# Altium project POD-Design-v1.0.PrjPcb (part 5 of 7)

## Sheet Ground-Fault-Detect-Sheet-1.SchDoc
size 420 x 297 mm; SheetNumber: 9; SheetTotal: 11
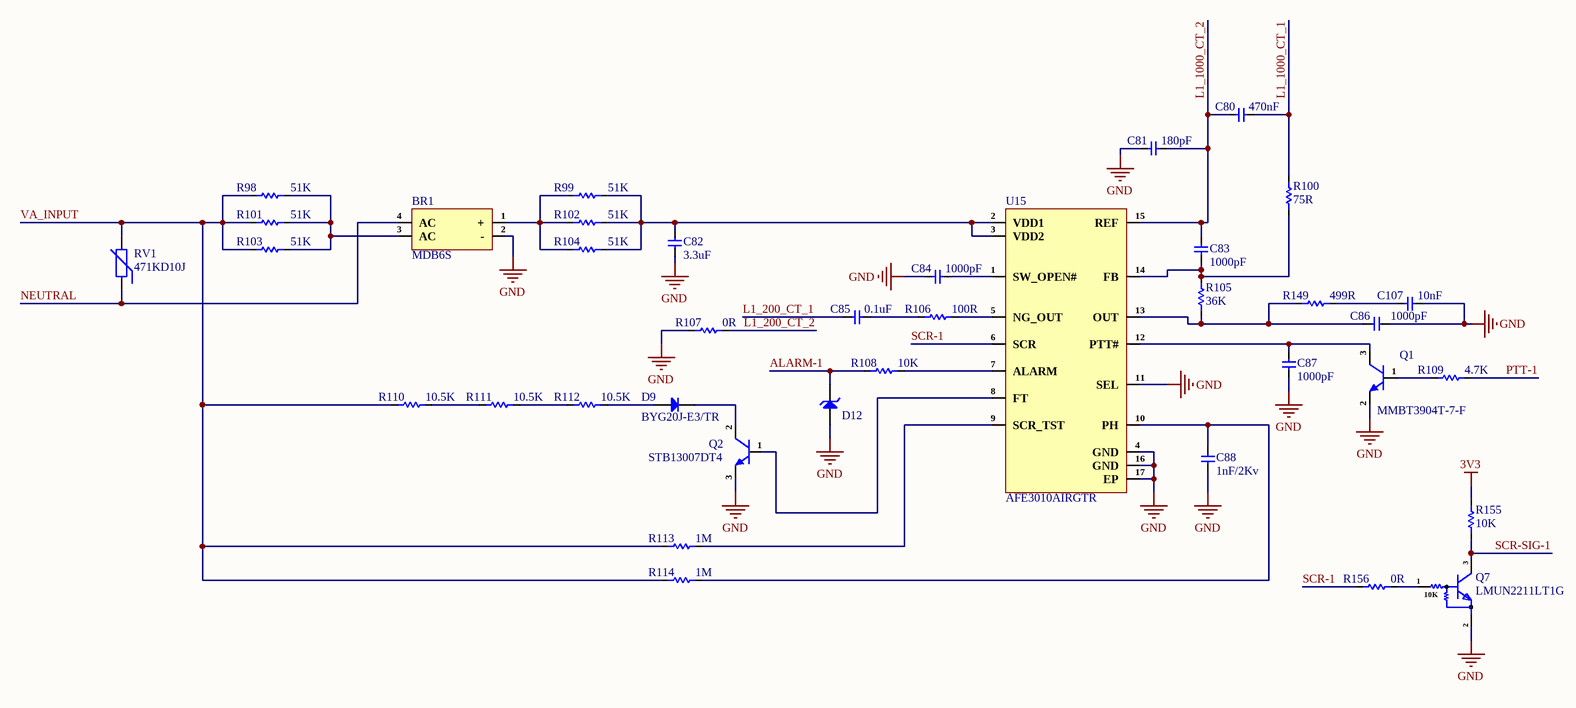
[diagram p8: Ground-Fault-Detect-Sheet-1.SchDoc]

### Parts
BR1  MDB6S  [TSSOP-4(5.0x4.4)]
C80  470nF  [Cap-0603]
C81  180pF  [Cap-0603]
C82  3.3uF  [Cap 2220]
C83  1000pF  [Cap-0603]
C84  1000pF  [Cap-0603]
C85  0.1uF  [Cap-0603]
C86  1000pF  [Cap-0603]
C87  1000pF  [Cap-0603]
C88  1nF/2Kv  [Cap 1808]
C107  10nF  [Cap-0603]
D9  BYG20J-E3/TR  [SMA(DO-214AC)]
D12  MM3Z3V3B  [SOD323F]  (value not drawn)
Q1  MMBT3904T-7-F  [SOT-523]
Q2  STB13007DT4  [D2PAK]
Q7  LMUN2211LT1G  [SOT-23]
R98  51K  [Res-2030]
R99  51K  [Res-2030]
R100  75R  [Res-0603]
R101  51K  [Res-2030]
R102  51K  [Res-2030]
R103  51K  [Res-2030]
R104  51K  [Res-2030]
R105  36K  [Res-0603]
R106  100R  [Res-0603]
R107  0R  [Res-0603]
R108  10K  [Res-0603]
R109  4.7K  [Res-0603]
R110  10.5K  [RES-2010]
R111  10.5K  [RES-2010]
R112  10.5K  [RES-2010]
R113  1M  [RES-2010]
R114  1M  [RES-2010]
R149  499R  [Res-0603]
R155  10K  [Res-0402]
R156  0R  [Res-0603]
RV1  471KD10J  [471KD10J]
U15  AFE3010AIRGTR  [VQFN-16(3x3)]

### Nets
3V3: R155.1
GND: BR1.2(-) C81.1 C82.1 C84.1 C86.1 C87.1 C88.1 C107.2 D12.1(A) Q1.2(E) Q2.3(E) Q7.2(E) R107.1 U15.4(GND) U15.11(SEL) U15.16(GND) U15.17(EP)
ALARM-1: D12.2(K) R108.1
L1_200_CT_1: C85.2
L1_200_CT_2: R107.2
L1_1000_CT_1: C80.2 R100.2
L1_1000_CT_2: C80.1 C81.2 C83.1 U15.15(REF)
NEUTRAL: BR1.4(AC) RV1.1
PTT-1: R109.2
SCR-1: R156.1 U15.6(SCR)
SCR-SIG-1: Q7.3(C) R155.2
VA_INPUT: R98.1 R101.1 R103.1 R110.1 R113.1 R114.1 RV1.2
NetBR1_1: BR1.1(+) R99.1 R102.1 R104.1
NetBR1_3: BR1.3(AC) R98.2 R101.2 R103.2
NetC82_2: C82.2 R99.2 R102.2 R104.2 U15.2(VDD1) U15.3(VDD2)
NetC83_2: C83.2 R100.1 R105.2 U15.14(FB)
NetC84_2: C84.2 U15.1(SW_OPEN#)
NetC85_1: C85.1 R106.1
NetC86_2: C86.2 R105.1 R149.1 U15.13(OUT)
NetC87_2: C87.2 Q1.3(C) U15.12(PTT#)
NetC88_2: C88.2 R114.2 U15.10(PH)
NetC107_1: C107.1 R149.2
NetD9_1: D9.1(K) Q2.2(C)
NetD9_2: D9.2(A) R112.2
NetQ1_1: Q1.1(B) R109.1
NetQ2_1: Q2.1(B) U15.8(FT)
NetQ7_1: Q7.1(B) R156.2
NetR106_2: R106.2 U15.5(NG_OUT)
NetR108_2: R108.2 U15.7(ALARM)
NetR110_2: R110.2 R111.1
NetR111_2: R111.2 R112.1
NetR113_2: R113.2 U15.9(SCR_TST)

### Notes on the sheet
- ZyntelliTech
- File:
- Title:
- Date:
- Page
- Num:
- Total:
- Drawn By: Huzaifa Ali
- (in symbol LMUN2211LT1G) 10K

### Library data of the parts
BR1 = MDB6S: BRIDGE RECT 1P 600V 1A 4MICRODIP; Manufacturer: ON Semiconductor / Fairchild; Item Type: Diodes; Supplier: Future Electronics; LCSC Part Number: C895500; Manufacturer Part Number: MDB6S; RoHS: Yes; Stock: 170000; Pricing: 5000=0.128, 10000=0.126, 15000=0.125 (USD); Lead Free: 5697LeadFree; ComponentLink1URL: https://datasheet.ciiva.com/4433/mdb6s-195692-4433151.pdf?src-supplier=Mouser; ComponentLink1Description: https://datasheet.ciiva.com/4433/mdb6s-195692-4433151.pdf?src-supplier=Mouser; ComponentLink2URL: https://datasheet.ciiva.com/11195/mdb8s-11195777.pdf?src-supplier=Avnet; ComponentLink2Description: https://datasheet.ciiva.com/11195/mdb8s-11195777.pdf?src-supplier=Avnet; ComponentLink3URL: https://datasheet.ciiva.com/30480/0900766b81185ceb-30480759.pdf?src-supplier=Rs; ComponentLink3Description: https://datasheet.ciiva.com/30480/0900766b81185ceb-30480759.pdf?src-supplier=Rs; ComponentLink4URL: https://datasheet.ciiva.com/6390/mdb10s-6390582.pdf?src-supplier=Digikey; ComponentLink4Description: https://datasheet.ciiva.com/6390/mdb10s-6390582.pdf?src-supplier=Digikey; ComponentLink5URL: https://datasheet.ciiva.com/6390/mdb10s-6390583.pdf?src-supplier=Digikey; ComponentLink5Description: https://datasheet.ciiva.com/6390/mdb10s-6390583.pdf?src-supplier=Digikey; ComponentLink6URL: https://datasheet.ciiva.com/6390/mdb10s-6390584.pdf?src-supplier=Digikey; ComponentLink6Description: https://datasheet.ciiva.com/6390/mdb10s-6390584.pdf?src-supplier=Digikey
C80 = CC0603KRX5R9BB474: CAP CER 0.47UF 50V X5R 0603; Manufacturer: Yageo; Tolerance: 10%; Item Type: Capacitor; Supplier 1: Digi-Key; Manufacturer Part Number: CC0603KRX5R9BB474; RoHS: Yes; Category: Ceramic Capacitors; Stock 1: 15145; Pricing 1: 1=0.45000, 10=0.31400, 50=0.22000, 100=0.18860, 500=0.14144, 1000=0.11944 (USD); Mount: Surface Mount; Case/Package: 0603; Min Operating Temperature: -55°C; Max Operating Temperature: 85°C; Packaging: Tape and Reel; Capacitance: 470nF; Voltage Rating: 50V; Voltage Rating (DC): 50V; Dielectric: X5R; Length: 0.063inch; Width: 0.031inch; Thickness: 0.035inch; Lead Free: Lead Free; Halogen Free: Halogen Free; RoHS Compliant: Yes; ComponentLink1URL: https://www.mouser.com/ds/2/447/ProductSelectionGuide 2014_Final_2-1131690.pdf?src-supplier=Mouser; ComponentLink1Description: https://www.mouser.com/ds/2/447/ProductSelectionGuide 2014_Final_2-1131690.pdf?src-supplier=Mouser; ComponentLink2URL: http://www.yageo.com/documents/recent/UPY-GPHC_X5R_4V-to-50V_25.pdf?src-supplier=Digi-Key; ComponentLink2Description: http://www.yageo.com/documents/recent/UPY-GPHC_X5R_4V-to-50V_25.pdf?src-supplier=Digi-Key; ComponentLink3URL: http://www.yageo.com/exep/pages/download/literatures/ProductSelectionGuide%202014_Final_2.pdf?src-supplier=Digi-Key; ComponentLink3Description: http://www.yageo.com/exep/pages/download/literatures/ProductSelectionGuide%202014_Final_2.pdf?src-supplier=Digi-Key; Supplier Part Number 1: 311-4047-1-ND; LCSC Part Number: C513651
C81 = CC0603JRNPO9BN181: CAP CER 180PF 50V C0G/NPO 0603; Manufacturer: Yageo; Item Type: Capacitors; Supplier: Arrow Electronics; LCSC Part Number: C107041; Manufacturer Part Number: CC0603JRNPO9BN181; RoHS: Yes; Stock: 3012000; Pricing: 4000=0.006, 8000=0.0057, 12000=0.0056, 20000=0.0055, 40000=0.0055, 200000=0.0053 (USD); ComponentLink1URL: https://datasheet.ciiva.com/26862/getdatasheetpartid-403527-26862762.pdf?src-supplier=Verical; ComponentLink1Description: https://datasheet.ciiva.com/26862/getdatasheetpartid-403527-26862762.pdf?src-supplier=Verical; ComponentLink2URL: https://datasheet.ciiva.com/176/mlccorderingcode-176405.pdf?src-supplier=Digikey; ComponentLink2Description: https://datasheet.ciiva.com/176/mlccorderingcode-176405.pdf?src-supplier=Digikey; ComponentLink3URL: https://datasheet.ciiva.com/176/mlccorderingcode-176406.pdf?src-supplier=Digikey; ComponentLink3Description: https://datasheet.ciiva.com/176/mlccorderingcode-176406.pdf?src-supplier=Digikey; ComponentLink4URL: https://datasheet.ciiva.com/176/mlccorderingcode-176407.pdf?src-supplier=Digikey; ComponentLink4Description: https://datasheet.ciiva.com/176/mlccorderingcode-176407.pdf?src-supplier=Digikey; ComponentLink5URL: https://datasheet.ciiva.com/5427/upy-gp-np0-16v-to-50v-8-5427755.pdf?src-supplier=Mouser; ComponentLink5Description: https://datasheet.ciiva.com/5427/upy-gp-np0-16v-to-50v-8-5427755.pdf?src-supplier=Mouser; ComponentLink6URL: https://datasheet.ciiva.com/8033/1443161-8033736.pdf?src-supplier=Element14; ComponentLink6Description: https://datasheet.ciiva.com/8033/1443161-8033736.pdf?src-supplier=Element14; ComponentLink7URL: https://datasheet.ciiva.com/8033/1443161-8033738.pdf?src-supplier=Element14; ComponentLink7Description: https://datasheet.ciiva.com/8033/1443161-8033738.pdf?src-supplier=Element14; ComponentLink8URL: https://datasheet.ciiva.com/7978/1132289-7978133.pdf?src-supplier=Element14; ComponentLink8Description: https://datasheet.ciiva.com/7978/1132289-7978133.pdf?src-supplier=Element14
C82 = FS55X335K251EHG: 250V 3.3uF X7R ±10% 2220 Multilayer Ceramic Capacitors MLCC - SMD/SMT ROHS; Manufacturer: PSA(Prosperity Dielectrics); Manufacturer Part Number: FS55X335K251EHG; Package: 2220; LCSC Part Number: C22370027; Item Type: Capacitor; ComponentLink1Description: LCSC; ComponentLink1URL: https://www.lcsc.com/product-detail/Multilayer-Ceramic-Capacitors-MLCC-SMD-SMT_PSA-Prosperity-Dielectrics-FS55X335K251EHG_C22370027.html
C83 C84 C86 C87 = 06031C102KAT2A: CAP CER 1000PF 100V X7R 0603; Manufacturer: Kyocera AVX; Item Type: Capacitor; Supplier: Avnet; LCSC Part Number: C2167292; Manufacturer Part Number: 06031C102KAT2A; RoHS: Yes; Stock: 656000; Pricing: 4000=0.0086, 8000=0.0084, 16000=0.0082, 24000=0.008, 32000=0.0079 (USD); Lead Free: 5697LeadFree; ComponentLink1URL: https://datasheet.ciiva.com/5422/cx7r-218113-5422905.pdf?src-supplier=Mouser; ComponentLink1Description: https://datasheet.ciiva.com/5422/cx7r-218113-5422905.pdf?src-supplier=Mouser; ComponentLink2URL: https://datasheet.ciiva.com/11499/cx7r-11499669.pdf?src-supplier=Avnet; ComponentLink2Description: https://datasheet.ciiva.com/11499/cx7r-11499669.pdf?src-supplier=Avnet; ComponentLink3URL: https://datasheet.ciiva.com/2987/cx7r-2987733.pdf?src-supplier=Avnet; ComponentLink3Description: https://datasheet.ciiva.com/2987/cx7r-2987733.pdf?src-supplier=Avnet; ComponentLink4URL: https://datasheet.ciiva.com/150/cx7r-150395.pdf?src-supplier=Digikey; ComponentLink4Description: https://datasheet.ciiva.com/150/cx7r-150395.pdf?src-supplier=Digikey; ComponentLink5URL: https://datasheet.ciiva.com/150/cx7r-150396.pdf?src-supplier=Digikey; ComponentLink5Description: https://datasheet.ciiva.com/150/cx7r-150396.pdf?src-supplier=Digikey; ComponentLink6URL: https://datasheet.ciiva.com/150/cx7r-150397.pdf?src-supplier=Digikey; ComponentLink6Description: https://datasheet.ciiva.com/150/cx7r-150397.pdf?src-supplier=Digikey; ComponentLink7URL: https://datasheet.ciiva.com/1124/1679506-1124198.pdf?src-supplier=Element14; ComponentLink7Description: https://datasheet.ciiva.com/1124/1679506-1124198.pdf?src-supplier=Element14; ComponentLink8URL: https://datasheet.ciiva.com/22693/1679506-22693579.pdf?src-supplier=Element14; ComponentLink8Description: https://datasheet.ciiva.com/22693/1679506-22693579.pdf?src-supplier=Element14; ComponentLink9URL: https://datasheet.ciiva.com/7855/1679506-7855033.pdf?src-supplier=Element14; ComponentLink9Description: https://datasheet.ciiva.com/7855/1679506-7855033.pdf?src-supplier=Element14; ComponentLink10URL: https://datasheet.ciiva.com/7855/84526-7855189.pdf?src-supplier=Element14; ComponentLink10Description: https://datasheet.ciiva.com/7855/84526-7855189.pdf?src-supplier=Element14; ComponentLink11URL: https://datasheet.ciiva.com/16289/cx7r-16289400.pdf?src-supplier=Future+Electronics; ComponentLink11Description: https://datasheet.ciiva.com/16289/cx7r-16289400.pdf?src-supplier=Future+Electronics; ComponentLink12URL: https://datasheet.ciiva.com/14594/70001075-14594623.pdf?src-supplier=Allied+Electronics; ComponentLink12Description: https://datasheet.ciiva.com/14594/70001075-14594623.pdf?src-supplier=Allied+Electronics; ComponentLink13URL: https://datasheet.ciiva.com/14600/70001075-14600988.pdf?src-supplier=Allied+Electronics; ComponentLink13Description: https://datasheet.ciiva.com/14600/70001075-14600988.pdf?src-supplier=Allied+Electronics
C85 = CC0603KRX7R0BB104: CAP CER 0.1UF 100V X7R 0603; Manufacturer: Yageo; Capacitance: 100nF; Tolerance: 10%; Item Type: Capacitor; Supplier 1: Digi-Key; Manufacturer Part Number: CC0603KRX7R0BB104; RoHS: Yes; Category: Ceramic Capacitors; Stock 1: 60476; Pricing 1: 1=0.19000, 10=0.13500, 50=0.07680, 100=0.06370, 500=0.04466, 1000=0.03696 (USD); Mount: Surface Mount; Case/Package: 0603; Case Code (Metric): 1608; Case Code (Imperial): 0603; Weight: 7.1E-05oz; Min Operating Temperature: -55°C; Max Operating Temperature: 125°C; Package Quantity: 4000; Voltage Rating: 100V; Packaging: Tape and Reel; Dielectric: X7R; Termination: SMD/SMT; Resistor Type: Ceramic; Voltage Rating (DC): 100V; Series: CC; Length: 0.063inch; Width: 0.031inch; Thickness: 0.035inch; Depth: 0.8mm; Lead Free: Lead Free; RoHS Compliant: Yes; ComponentLink1URL: https://datasheet.ciiva.com/6277/mlccorderingcode-6277030.pdf?src-supplier=Digi-Key; ComponentLink1Description: https://datasheet.ciiva.com/6277/mlccorderingcode-6277030.pdf?src-supplier=Digi-Key; ComponentLink2URL: https://datasheet.ciiva.com/6277/mlccorderingcode-6277081.pdf?src-supplier=Digi-Key; ComponentLink2Description: https://datasheet.ciiva.com/6277/mlccorderingcode-6277081.pdf?src-supplier=Digi-Key; ComponentLink3URL: https://datasheet.ciiva.com/6277/mlccorderingcode-6277082.pdf?src-supplier=Digi-Key; ComponentLink3Description: https://datasheet.ciiva.com/6277/mlccorderingcode-6277082.pdf?src-supplier=Digi-Key; Supplier Part Number 1: 311-1523-1-ND; LCSC Part Number: C113803
C88 = GR442QR73D102KW01L: CAP CER 1000PF 2KV X7R 1808; Manufacturer: Murata; Item Type: Capacitor; Value: 1nF; Tolerance: 10%; Supplier: Future Electronics; LCSC Part Number: C76916; Manufacturer Part Number: GR442QR73D102KW01L; RoHS: Yes; Stock: 2000; Pricing: 2000=0.235, 4000=0.23, 6000=0.23, 8000=0.225, 10000=0.22 (USD); Mounting Technology: Surface Mount; Case/Package: 1808; Case Code (Imperial): 1808; Case Code (Metric): 4520; Min Operating Temperature: -55°C; Max Operating Temperature: 125°C; Packaging: Tape and Reel; Voltage Rating: 2kV; Package Quantity: 1; Termination: SMD/SMT; Series: GR4; Construction: Flat; Voltage Rating (DC): 2kV; Dielectric: X7R; Voltage: 2kV; Length: 4.5mm; Width: 0.079inch; Height: 1.5mm; Depth: 2mm; Thickness: 0.059inch; Radiation Hardening: No; RoHS Compliant: Yes; Reach SVHC Compliant: No; Lead Free: Lead Free; ComponentLink1URL: https://datasheet.ciiva.com/11789/0900766b80ef921d-11789101.pdf?src-supplier=Rs; ComponentLink1Description: https://datasheet.ciiva.com/11789/0900766b80ef921d-11789101.pdf?src-supplier=Rs; ComponentLink2URL: https://datasheet.ciiva.com/18183/getdatasheetpartid-149668-18183889.pdf?src-supplier=Verical; ComponentLink2Description: https://datasheet.ciiva.com/18183/getdatasheetpartid-149668-18183889.pdf?src-supplier=Verical; ComponentLink3URL: https://datasheet.ciiva.com/29540/product-29540570.pdf?src-supplier=Digikey; ComponentLink3Description: https://datasheet.ciiva.com/29540/product-29540570.pdf?src-supplier=Digikey; ComponentLink4URL: https://datasheet.ciiva.com/29540/partnumbering-e-01-29540571.pdf?src-supplier=Digikey; ComponentLink4Description: https://datasheet.ciiva.com/29540/partnumbering-e-01-29540571.pdf?src-supplier=Digikey; ComponentLink5URL: https://datasheet.ciiva.com/16497/product-16497100.pdf?src-supplier=Future+Electronics; ComponentLink5Description: https://datasheet.ciiva.com/16497/product-16497100.pdf?src-supplier=Future+Electronics
C107 = CC0603KRX7R9BB103: CAP CER 10000PF 50V X7R 0603; Manufacturer: Yageo; Material: Ceramic; Tolerance: 10%; Insulation Resistance: 100GR; Supplier 1: Digi-Key; Manufacturer Part Number: CC0603KRX7R9BB103; Stock 1: 8411467; Pricing 1: 1=0.1, 10=0.038, 100=0.0171, 500=0.01224, 1000=0.00962 (USD); Mount: Surface Mount; Case/Package: 0603; Number of Pins: 2; Case Code (Metric): 1608; Case Code (Imperial): 0603; Min Operating Temperature: -55°C; Max Operating Temperature: 125°C; Capacitance: 10nF; Dielectric: X7R; Voltage: 50V; Packaging: Tape and Reel; Voltage Rating: 50V; Voltage Rating (DC): 50V; Package Quantity: 1; Termination: SMD/SMT; Composition: Ceramic; Length: 1.6mm; Height: 0.8mm; Width: 0.031inch; Thickness: 0.035inch; Depth: 0.8mm; Radiation Hardening: No; REACH SVHC: No SVHC; Lead Free: Lead Free; Halogen Free: Halogen Free; ComponentLink1URL: http://www.farnell.com/datasheets/1734573.pdf?src-supplier=Element14; ComponentLink1Description: http://www.farnell.com/datasheets/1734573.pdf?src-supplier=Element14; ComponentLink2URL: http://www.yageo.com/documents/recent/UPY-GPHC_X7R_6.3V-to-50V_18.pdf?src-supplier=Digi-Key; ComponentLink2Description: http://www.yageo.com/documents/recent/UPY-GPHC_X7R_6.3V-to-50V_18.pdf?src-supplier=Digi-Key; ComponentLink3URL: http://www.farnell.com/datasheets/2167236.pdf?src-supplier=Mouser; ComponentLink3Description: http://www.farnell.com/datasheets/2167236.pdf?src-supplier=Mouser; ComponentLink4URL: http://www.farnell.com/datasheets/70765.pdf?src-supplier=Element14; ComponentLink4Description: http://www.farnell.com/datasheets/70765.pdf?src-supplier=Element14; ComponentLink5URL: http://www.yageo.com/documents/recent/UPY-GPHC_X7R_6.3V-to-50V_8.pdf?src-supplier=Avnet+Europe; ComponentLink5Description: http://www.yageo.com/documents/recent/UPY-GPHC_X7R_6.3V-to-50V_8.pdf?src-supplier=Avnet+Europe; ComponentLink6URL: http://www.farnell.com/datasheets/1489800.pdf?src-supplier=Element14; ComponentLink6Description: http://www.farnell.com/datasheets/1489800.pdf?src-supplier=Element14; ComponentLink7URL: https://www.verical.com/server-webapp/html/getDatasheet?partID=403582&src-supplier=Verical; ComponentLink7Description: https://www.verical.com/server-webapp/html/getDatasheet?partID=403582&src-supplier=Verical; Supplier Part Number 1: 311-1085-6-ND; LCSC Part Number: C100042
D9 = BYG20J-E3/TR: DIODE AVAL 600V 1.5A DO214AC; Manufacturer: Vishay Semiconductors; Item Type: Diodes; Supplier: Mouser; LCSC Part Number: C241925; Manufacturer Part Number: BYG20J-E3/TR; RoHS: Yes; Stock: 105610; Pricing: 1=0.34, 10=0.207, 50=0.207, 100=0.145, 1000=0.096, 10000=0.088 (USD); ComponentLink1URL: https://datasheet.ciiva.com/23642/1748785-23642024.pdf?src-supplier=Newark; ComponentLink1Description: https://datasheet.ciiva.com/23642/1748785-23642024.pdf?src-supplier=Newark; ComponentLink2URL: https://datasheet.ciiva.com/4452/byg20d-205199-4452450.pdf?src-supplier=Mouser; ComponentLink2Description: https://datasheet.ciiva.com/4452/byg20d-205199-4452450.pdf?src-supplier=Mouser; ComponentLink3URL: https://datasheet.ciiva.com/5779/1795675-5779021.pdf?src-supplier=Farnell; ComponentLink3Description: https://datasheet.ciiva.com/5779/1795675-5779021.pdf?src-supplier=Farnell; ComponentLink4URL: https://datasheet.ciiva.com/1178/57063-1178161.pdf?src-supplier=Element14; ComponentLink4Description: https://datasheet.ciiva.com/1178/57063-1178161.pdf?src-supplier=Element14; ComponentLink5URL: https://datasheet.ciiva.com/1178/57063-1178162.pdf?src-supplier=Element14; ComponentLink5Description: https://datasheet.ciiva.com/1178/57063-1178162.pdf?src-supplier=Element14
D12 = MM3Z3V3B: DIODE ZENER 3.3V 200MW SOD323F; Manufacturer: ON Semiconductor / Fairchild; Forward Voltage: 1V; Tolerance: 2%; Impedance: 89R; Max Reverse Leakage Current: 4.5uA; Test Current: 5mA; Element Configuration: Single; Supplier 1: Digi-Key; Manufacturer Part Number: MM3Z3V3B; Stock 1: 473644; Pricing 1: 1=0.22, 10=0.18, 100=0.0956, 500=0.06288, 1000=0.04276 (USD); Mount: Surface Mount; Number of Pins: 2; Weight: 0.0276g; Min Operating Temperature: -65°C; Max Operating Temperature: 150°C; Packaging: Tape and Reel; Package Quantity: 1; Max Power Dissipation: 200mW; Zener Voltage: 3.3V; Voltage Tolerance: 2%; Power Dissipation: 200mW; Working Voltage: 3.3V; Peak Reverse Current: 4.5uA; Length: 1.3mm; Height: 1mm; Width: 1.7mm; Radiation Hardening: No; REACH SVHC: No SVHC; Lead Free: Lead Free; ComponentLink1URL: http://www.onsemi.com/pub/Collateral/MM3Z9V1B-D.pdf?src-supplier=Digi-Key; ComponentLink1Description: http://www.onsemi.com/pub/Collateral/MM3Z9V1B-D.pdf?src-supplier=Digi-Key; ComponentLink2URL: http://www.mouser.com/ds/2/149/MM3Z3V3B-187166.pdf?src-supplier=Mouser; ComponentLink2Description: http://www.mouser.com/ds/2/149/MM3Z3V3B-187166.pdf?src-supplier=Mouser; ComponentLink3URL: https://www.fairchildsemi.com/datasheets/MM/MM3Z9V1B.pdf?src-supplier=Avnet; ComponentLink3Description: https://www.fairchildsemi.com/datasheets/MM/MM3Z9V1B.pdf?src-supplier=Avnet; ComponentLink4URL: http://www.farnell.com/datasheets/1706525.pdf?src-supplier=Element14; ComponentLink4Description: http://www.farnell.com/datasheets/1706525.pdf?src-supplier=Element14; Supplier Part Number 1: MM3Z3V3BCT-ND; LCSC Part Number: C2978865; Item Type: Diode
Q1 = MMBT3904T-7-F: TRANS NPN 40V 0.2A SOT523; Manufacturer: Diodes Zetex; Item Type: Transistor; Supplier: Future Electronics; Supplier Part Number: 4140292; Manufacturer Part Number: MMBT3904T-7-F; RoHS: Yes; Category: BJTs; Stock: 36000; Pricing: 3000=0.0261, 9000=0.0252, 15000=0.0248, 60000=0.0236, 90000=0.0229 (USD); ComponentLink1URL: https://datasheet.ciiva.com/15139/getdatasheetpartid-142850-15139485.pdf?src-supplier=Verical; ComponentLink1Description: https://datasheet.ciiva.com/15139/getdatasheetpartid-142850-15139485.pdf?src-supplier=Verical; ComponentLink2URL: https://datasheet.ciiva.com/11199/ds30270-11199009.pdf?src-supplier=Avnet; ComponentLink2Description: https://datasheet.ciiva.com/11199/ds30270-11199009.pdf?src-supplier=Avnet; ComponentLink3URL: https://datasheet.ciiva.com/17053/0900766b80e49818-17053736.pdf?src-supplier=Allied+Electronics; ComponentLink3Description: https://datasheet.ciiva.com/17053/0900766b80e49818-17053736.pdf?src-supplier=Allied+Electronics; ComponentLink4URL: https://datasheet.ciiva.com/8029/ds30270-8029717.pdf?src-supplier=Element14; ComponentLink4Description: https://datasheet.ciiva.com/8029/ds30270-8029717.pdf?src-supplier=Element14; ComponentLink5URL: https://datasheet.ciiva.com/22711/480146-22711751.pdf?src-supplier=Element14; ComponentLink5Description: https://datasheet.ciiva.com/22711/480146-22711751.pdf?src-supplier=Element14; ComponentLink6URL: https://datasheet.ciiva.com/4723/ds30270-4723401.pdf?src-supplier=Mouser; ComponentLink6Description: https://datasheet.ciiva.com/4723/ds30270-4723401.pdf?src-supplier=Mouser; ComponentLink7URL: https://datasheet.ciiva.com/6360/ds30270-6360919.pdf?src-supplier=Digikey; ComponentLink7Description: https://datasheet.ciiva.com/6360/ds30270-6360919.pdf?src-supplier=Digikey; LCSC Part Number: C239187
Q2 = STB13007DT4: TRANS NPN 400V 8A D2PAK; Manufacturer: STMicroelectronics; Item Type: BJTs; Supplier: Arrow Electronics; LCSC Part Number: C500928; Manufacturer Part Number: STB13007DT4; RoHS: Yes; Stock: 1694; Pricing: 1=1.5973, 10=1.0989, 25=1.0879, 100=0.7233, 250=0.7161, 500=0.6025, 1000=0.4613 (USD); ComponentLink1URL: https://datasheet.ciiva.com/22733/1689954-22733255.pdf?src-supplier=Element14; ComponentLink1Description: https://datasheet.ciiva.com/22733/1689954-22733255.pdf?src-supplier=Element14; ComponentLink2URL: https://datasheet.ciiva.com/977/cd00116674-977035.pdf?src-supplier=Digikey; ComponentLink2Description: https://datasheet.ciiva.com/977/cd00116674-977035.pdf?src-supplier=Digikey; ComponentLink3URL: https://datasheet.ciiva.com/977/cd00116674-977036.pdf?src-supplier=Digikey; ComponentLink3Description: https://datasheet.ciiva.com/977/cd00116674-977036.pdf?src-supplier=Digikey; ComponentLink4URL: https://datasheet.ciiva.com/977/cd00116674-977037.pdf?src-supplier=Digikey; ComponentLink4Description: https://datasheet.ciiva.com/977/cd00116674-977037.pdf?src-supplier=Digikey; ComponentLink5URL: https://datasheet.ciiva.com/11198/cd00116674-11198854.pdf?src-supplier=Avnet; ComponentLink5Description: https://datasheet.ciiva.com/11198/cd00116674-11198854.pdf?src-supplier=Avnet; ComponentLink6URL: https://datasheet.ciiva.com/16490/cd00116674-16490093.pdf?src-supplier=Future+Electronics; ComponentLink6Description: https://datasheet.ciiva.com/16490/cd00116674-16490093.pdf?src-supplier=Future+Electronics; ComponentLink7URL: https://datasheet.ciiva.com/4722/cd00116674-4722268.pdf?src-supplier=Mouser; ComponentLink7Description: https://datasheet.ciiva.com/4722/cd00116674-4722268.pdf?src-supplier=Mouser
Q7 = LMUN2211LT1G: NPN 246mW 100mA 50V SOT-23 Digital Transistors ROHS; Manufacturer: LRC; Item Type: Mosfet; Manufacturer Part Number: LMUN2211LT1G; Package: SOT-23; LCSC Part Number: C12775; ComponentLink1Description: LCSC; ComponentLink1URL: https://www.lcsc.com/product-detail/Digital-Transistors_LRC-LMUN2211LT1G_C12775.html
R98 R99 R101-R104 = CRW2030J51K0E01Z: 3W Thick Film Resistors ±100ppm/℃ ±5% 51kΩ 2030 Chip Resistor - Surface Mount ROHS; Manufacturer: Ever Ohms Tech; Manufacturer Part Number: CRW2030J51K0E01Z; Package: 2030; LCSC Part Number: C175634; Item Type: Resistor; ComponentLink1Description: LCSC; ComponentLink1URL: https://www.lcsc.com/product-detail/Chip-Resistor-Surface-Mount_Ever-Ohms-Tech-CRW2030J51K0E01Z_C175634.html
R100 = RC0603FR-0775RL: RES 75 OHM 1% 1/10W 0603; Manufacturer: Yageo; Temperature Coefficient: 100ppm/°C; Voltage Rating (DC): 50V; Power Rating: 100mW; Item Type: Resistor; Supplier: Digikey; Supplier Part Number: 311-75.0HRCT-ND; Manufacturer Part Number: RC0603FR-0775RL; RoHS: Yes; Category: Chip SMD Resistors; Stock: 844005; Pricing: 1=0.1, 10=0.019, 50=0.0112, 100=0.0093, 500=0.00622, 1000=0.00532 (USD); Case/Package: 0603; Case Code (Metric): 1608; Case Code (Imperial): 0603; Min Operating Temperature: -55°C; Max Operating Temperature: 155°C; Value: 75R; Tolerance: 1%; Resistor Type: Thick Film; Packaging: Tape and Reel; Voltage Rating: 50V; Package Quantity: 1; Number of Terminations: 2; Termination: SMD/SMT; Max Power Dissipation: 100mW; Features: Moisture Resistant; Series: RC; Resistance Tolerance: 1%; Construction: Rectangular; Technology: THICK FILM; Length: 0.063inch; Width: 0.031inch; Height: 0.022inch; Depth: 0.8mm; Lead Free: 5697LeadFree; Reach SVHC Compliant: No; Military Standard: Not; RoHS Compliant: Yes; LCSC Part Number: C112309
R105 = RC0603FR-0736KL: RES SMD 36K Ohm 1% 0.1W 0603; Manufacturer: Yageo; Resistance: 36kR; Power Rating: 100mW; Temperature Coefficient: 100ppm/°C; Voltage Rating (DC): 50V; Voltage Rating: 75V; Supplier 1: Digi-Key; Manufacturer Part Number: RC0603FR-0736KL; RoHS: Yes; Category: Chip SMD Resistors; Stock 1: 463498; Pricing 1: 1=0.10000, 10=0.02400, 100=0.00970, 1000=0.00436, 2500=0.00378 (USD); Mount: Surface Mount; Case/Package: 0603; Case Code (Metric): 1608; Case Code (Imperial): 0603; Weight: 7.1E-05oz; Size Code: 0603; Min Operating Temperature: -55°C; Max Operating Temperature: 155°C; Tolerance: 1%; Packaging: Tape and Reel; Package Quantity: 1; Resistor Type: Thick Film; Number of Terminations: 2; Termination: SMD/SMT; Max Power Dissipation: 100mW; Features: Moisture Resistant; Series: RC; Construction: Rectangular; Length: 1.6mm; Width: 0.031inch; Height: 0.022inch; Depth: 0.8mm; Lead Free: Lead Free; Military Standard: Not; RoHS Compliant: Yes; ComponentLink1URL: https://datasheet.ciiva.com/2454/pyu-r-int-thick-7-2454483.pdf?src-supplier=Digi-Key; ComponentLink1Description: https://datasheet.ciiva.com/2454/pyu-r-int-thick-7-2454483.pdf?src-supplier=Digi-Key; ComponentLink2URL: https://datasheet.ciiva.com/2454/pyu-r-int-thick-7-2454484.pdf?src-supplier=Digi-Key; ComponentLink2Description: https://datasheet.ciiva.com/2454/pyu-r-int-thick-7-2454484.pdf?src-supplier=Digi-Key; ComponentLink3URL: https://datasheet.ciiva.com/2454/pyu-r-int-thick-7-2454485.pdf?src-supplier=Digi-Key; ComponentLink3Description: https://datasheet.ciiva.com/2454/pyu-r-int-thick-7-2454485.pdf?src-supplier=Digi-Key; Supplier Part Number 1: 311-36.0KHRCT-ND; LCSC Part Number: C114619
R106 = RC0603FR-07100RL: RES SMD 100 OHM 1% 1/10W 0603; Manufacturer: Yageo; Temperature Coefficient: 100ppm/°C; Voltage Rating (DC): 50V; Power Rating: 100mW; Item Type: Resistor; Supplier 1: Arrow Electronics; Manufacturer Part Number: RC0603FR-07100RL; RoHS: Yes; Category: Chip SMD Resistors; Stock 1: 3800000; Pricing 1: 5000=0.00300, 5000=0.00200, 5000=0.00450, 50000=0.00410, 500000=0.00230, 2500000=0.00140 (USD); Case/Package: 0603; Number of Pins: 2; Case Code (Imperial): 0603; Case Code (Metric): 1608; Size Code: 0603; Min Operating Temperature: -55°C; Max Operating Temperature: 155°C; Resistance: 100R; Tolerance: 1%; Resistor Type: Thick Film; Packaging: Tape and Reel; Voltage Rating: 50V; Termination: SMD/SMT; Features: Moisture Resistant; Series: RC; Max Power Dissipation: 100mW; Number of Terminations: 2; Construction: Rectangular; Resistance Tolerance: 1%; Technology: THICK FILM; Length: 1.6mm; Width: 0.8mm; Height: 0.45mm; Depth: 0.8mm; REACH SVHC: Unknown; Lead Free: Lead Free; RoHS Compliant: Yes; Military Standard: Not; Supplier Part Number 1: RC0603FR-07100RL; LCSC Part Number: C105588
R107 R156 = RC0603JR-070RL: RES 0 OHM JUMPER 1/10W 0603; Manufacturer: Yageo; Resistance: 0mR; Tolerance: 1%; Power Rating: 100mW; Voltage Rating (DC): 50V; Temperature Coefficient: 200ppm/°C; Resistance Tolerance: 5%; Item Type: Resistor; Supplier 1: Digi-Key; Manufacturer Part Number: RC0603JR-070RL; RoHS: Yes; Category: Chip SMD Resistors; Stock 1: 18081776; Pricing 1: 1=0.10000, 10=0.01700, 25=0.01240, 50=0.00960, 100=0.00700, 250=0.00536, 500=0.00430, 1000=0.00316 (USD); Case/Package: 0603; Number of Pins: 2; Contact Plating: Tin,Matte; Case Code (Imperial): 0603; Case Code (Metric): 1608; Size Code: 0603; Min Operating Temperature: -55°C; Max Operating Temperature: 155°C; Resistor Type: Thick Film; Packaging: Tape and Reel; Termination: SMD/SMT; Series: RC; Technology: THICK FILM; Package Quantity: 5000; Voltage Rating: 50V; Features: Moisture Resistant; Max Power Dissipation: 100mW; Number of Terminations: 2; Construction: Rectangular; Length: 1.6mm; Width: 0.8mm; Height: 0.45mm; Depth: 0.8mm; Radiation Hardening: No; Reach SVHC Compliant: No SVHC; Lead Free: Lead Free; RoHS Compliant: Yes; Military Standard: Not; Supplier Part Number 1: 311-0.0GRCT-ND; LCSC Part Number: C95177
R108 = RT0603BRD0710KL: RES SMD 10K OHM 0.1% 1/10W 0603; Manufacturer: Yageo; Power: 100mW; Rated Temperature: 70°C; Value: 10kR; Temperature Coefficient: 25ppm/°C; Working Voltage: 75V; Package Height: 0.45mm; Package Length: 1.6mm; Package Width: 0.8mm; Item Type: Resistor; Supplier 1: Rs; Manufacturer Part Number: RT0603BRD0710KL; RoHS: Yes; Category: Chip SMD Resistors; Stock 1: 20510; Pricing 1: 100=0.29800, 250=0.27800, 500=0.25900, 1000=0.23700 (GBP); Mounting Technology: Surface Mount; Pins: 2; Case/Package: 0603; Min Operating Temperature: -55°C; Max Operating Temperature: 155°C; Tolerance: 0.1%; Resistor Type: FIXED RESISTOR; Construction: Chip; Package Style: SMTMeter; Packaging: Tape and Reel; Technology: THIN FILM; Termination: Wraparound; Reach SVHC Compliant: Yes; RoHS Compliant: Yes; ComponentLink1URL: https://datasheet.ciiva.com:443/pdfs/VipMasterIC/IC/YAGO/YAGO-S-A0008510989/YAGO-S-A0008510989-1.pdf?src-supplier=IHS+Markit; ComponentLink1Description: https://datasheet.ciiva.com:443/pdfs/VipMasterIC/IC/YAGO/YAGO-S-A0008510989/YAGO-S-A0008510989-1.pdf?src-supplier=IHS+Markit; ComponentLink2URL: https://datasheet.ciiva.com/5624/pyu-rt-1-to-0-05-rohs-l-4-5624351.pdf?src-supplier=Mouser; ComponentLink2Description: https://datasheet.ciiva.com/5624/pyu-rt-1-to-0-05-rohs-l-4-5624351.pdf?src-supplier=Mouser; ComponentLink3URL: https://datasheet.ciiva.com/29721/pyu-rt-1-to-0-05-rohs-l-4-29721177.pdf?src-supplier=Digi-Key; ComponentLink3Description: https://datasheet.ciiva.com/29721/pyu-rt-1-to-0-05-rohs-l-4-29721177.pdf?src-supplier=Digi-Key; Supplier Part Number 1: 1991391P; LCSC Part Number: C95204
R109 = RC0603FR-074K7L: RES SMD 4.7K OHM 1% 1/10W 0603; Manufacturer: Yageo; Item Type: Resistor; Manufacturer Part Number: RC0603FR-074K7L; Package: 0603; ComponentLink7Description: LCSC; ComponentLink7URL: https://www.lcsc.com/product-detail/Chip-Resistor-Surface-Mount_YAGEO-RC0603FR-074K7L_C99782.html; LCSC Part Number: C99782
R110-R112 = CRCW201010K5FKEF: RES SMD 10.5K OHM 1% 3/4W 2010; Manufacturer: Vishay Dale; Item Type: Resistors; Voltage Rating (DC): 400V; Supplier: Mouser; LCSC Part Number: C3009756; Manufacturer Part Number: CRCW201010K5FKEF; RoHS: Yes; Stock: 2385; Pricing: 1=0.22, 10=0.103, 50=0.103, 100=0.067, 1000=0.049, 10000=0.028 (USD); Lead Free: 5697LeadFree; ComponentLink1URL: https://datasheet.ciiva.com/48526/dcrcwe3-48526619.pdf?src-supplier=Avnet; ComponentLink1Description: https://datasheet.ciiva.com/48526/dcrcwe3-48526619.pdf?src-supplier=Avnet; ComponentLink2URL: https://datasheet.ciiva.com/2476/dcrcwe3-2476773.pdf?src-supplier=Digikey; ComponentLink2Description: https://datasheet.ciiva.com/2476/dcrcwe3-2476773.pdf?src-supplier=Digikey; ComponentLink3URL: https://datasheet.ciiva.com/2476/dcrcwe3-2476774.pdf?src-supplier=Digikey; ComponentLink3Description: https://datasheet.ciiva.com/2476/dcrcwe3-2476774.pdf?src-supplier=Digikey; ComponentLink4URL: https://datasheet.ciiva.com/2476/dcrcwe3-2476775.pdf?src-supplier=Digikey; ComponentLink4Description: https://datasheet.ciiva.com/2476/dcrcwe3-2476775.pdf?src-supplier=Digikey
R113 R114 = AS101AJ0105T4E: 1.5W Thick Film Resistors 400V ±100ppm/℃ ±5% 1MΩ 2010 Chip Resistor - Surface Mount ROHS; Manufacturer: UNI-ROYAL(Uniroyal Elec); Manufacturer Part Number: AS101AJ0105T4E; Package: 2010; LCSC Part Number: C965991; Item Type: Resistor; ComponentLink1Description: LCSC; ComponentLink1URL: https://www.lcsc.com/product-detail/Chip-Resistor-Surface-Mount_UNI-ROYAL-Uniroyal-Elec-AS101AJ0105T4E_C965991.html
R149 = RC0603FR-07499RL: RES 499 OHM 1% 1/10W 0603; Manufacturer: Yageo; Temperature Coefficient: 100ppm/°C; Power Rating: 100mW; Voltage Rating: 50V; Supplier 1: RSComponents; Manufacturer Part Number: RC0603FR-07499RL; RoHS: Yes; Category: Chip SMD Resistors; Stock 1: 900; Pricing 1: 5000=0.00300, 10000=0.00300, 15000=0.00300, 20000=0.00200 (GBP); Mount: Surface Mount; Case/Package: 0603; Contact Plating: Tin,Matte; Case Code (Metric): 1608; Case Code (Imperial): 0603; Size Code: 0603; Min Operating Temperature: -55°C; Max Operating Temperature: 155°C; Resistance: 499R; Tolerance: 1%; Resistor Type: Thick Film; Package Quantity: 1; Packaging: Tape and Reel; Number of Terminations: 2; Termination: SMD/SMT; Max Power Dissipation: 100mW; Voltage Rating (DC): 50V; Features: Moisture Resistant; Series: RC; Construction: Rectangular; Technology: THICK FILM; Length: 1.6mm; Width: 0.031inch; Height: 0.45mm; Depth: 0.8mm; Radiation Hardening: No; Military Standard: Not; Lead Free: Lead Free; RoHS Compliant: Yes; ComponentLink1URL: https://datasheet.ciiva.com/11808/0900766b80f96399-11808558.pdf?src-supplier=RSComponents; ComponentLink1Description: https://datasheet.ciiva.com/11808/0900766b80f96399-11808558.pdf?src-supplier=RSComponents; ComponentLink2URL: https://datasheet.ciiva.com/2453/pyu-r-int-thick-7-2453956.pdf?src-supplier=Digi-Key; ComponentLink2Description: https://datasheet.ciiva.com/2453/pyu-r-int-thick-7-2453956.pdf?src-supplier=Digi-Key; ComponentLink3URL: https://datasheet.ciiva.com/2453/pyu-r-int-thick-7-2453957.pdf?src-supplier=Digi-Key; ComponentLink3Description: https://datasheet.ciiva.com/2453/pyu-r-int-thick-7-2453957.pdf?src-supplier=Digi-Key; ComponentLink4URL: https://datasheet.ciiva.com/2453/pyu-r-int-thick-7-2453955.pdf?src-supplier=Digi-Key; ComponentLink4Description: https://datasheet.ciiva.com/2453/pyu-r-int-thick-7-2453955.pdf?src-supplier=Digi-Key; ComponentLink5URL: https://datasheet.ciiva.com/12558/rc0603-272842-12558391.pdf?src-supplier=Mouser; ComponentLink5Description: https://datasheet.ciiva.com/12558/rc0603-272842-12558391.pdf?src-supplier=Mouser; ComponentLink6URL: https://datasheet.ciiva.com/8885/pyu-rc0603-51-rohs-l-4-8885483.pdf?src-supplier=Avnet; ComponentLink6Description: https://datasheet.ciiva.com/8885/pyu-rc0603-51-rohs-l-4-8885483.pdf?src-supplier=Avnet; Supplier Part Number 1: 1995585; LCSC Part Number: C137714
R155 = RC0402FR-0710KL: RES 10K OHM 1% 1/16W 0402; Manufacturer: Yageo; Resistance: 10kR; Voltage Rating (DC): 50V; Temperature Coefficient: 100ppm/°C; Power Rating: 62.5mW; Max Power Dissipation: 63mW; Item Type: Resistor; Supplier 1: Mouser; Manufacturer Part Number: RC0402FR-0710KL; RoHS: Yes; Category: Chip SMD Resistors; Stock 1: 18648329; Pricing 1: 1=0.10000, 10=0.01400, 50=0.01400, 100=0.00500, 1000=0.00300, 10000=0.00200 (USD); Case/Package: 0402; Number of Pins: 2; Case Code (Imperial): 0402; Case Code (Metric): 1005; Min Operating Temperature: -55°C; Max Operating Temperature: 155°C; Resistor Type: Thick Film; Tolerance: 1%; Packaging: Tape and Reel; Voltage Rating: 50V; Termination: SMD/SMT; Working Voltage: 50V; Number of Terminations: 2; Features: Moisture Resistant; Series: RC; Resistance Tolerance: 1%; Construction: Rectangular; Length: 1mm; Width: 0.5mm; Height: 0.32mm; Depth: 0.5mm; Lead Pitch: 0.2mm; REACH SVHC: No SVHC; Lead Free: Lead Free; RoHS Compliant: Yes; Military Standard: Not; ComponentLink1URL: https://datasheet.ciiva.com/7660/38568-7660787.pdf?src-supplier=Element14; ComponentLink1Description: https://datasheet.ciiva.com/7660/38568-7660787.pdf?src-supplier=Element14; ComponentLink2URL: https://datasheet.ciiva.com/7849/1686128-7849814.pdf?src-supplier=Element14; ComponentLink2Description: https://datasheet.ciiva.com/7849/1686128-7849814.pdf?src-supplier=Element14; ComponentLink3URL: https://datasheet.ciiva.com/7983/1018594-7983486.pdf?src-supplier=Element14; ComponentLink3Description: https://datasheet.ciiva.com/7983/1018594-7983486.pdf?src-supplier=Element14; ComponentLink4URL: https://datasheet.ciiva.com/22747/1018594-22747512.pdf?src-supplier=Element14; ComponentLink4Description: https://datasheet.ciiva.com/22747/1018594-22747512.pdf?src-supplier=Element14; ComponentLink5URL: https://datasheet.ciiva.com/12667/pyu-rc0402-51-rohs-l-6-r-12667067.pdf?src-supplier=Mouser; ComponentLink5Description: https://datasheet.ciiva.com/12667/pyu-rc0402-51-rohs-l-6-r-12667067.pdf?src-supplier=Mouser; ComponentLink6URL: https://datasheet.ciiva.com/7849/1784430-7849813.pdf?src-supplier=Element14; ComponentLink6Description: https://datasheet.ciiva.com/7849/1784430-7849813.pdf?src-supplier=Element14; ComponentLink7URL: https://datasheet.ciiva.com/7849/1784430-7849815.pdf?src-supplier=Element14; ComponentLink7Description: https://datasheet.ciiva.com/7849/1784430-7849815.pdf?src-supplier=Element14; Supplier Part Number 1: 603-RC0402FR-0710KL; LCSC Part Number: C60490
RV1 = 471KD10J: 775V 385V 300V 470V Plugin Varistors ROHS; Manufacturer: Yageo; Supplier: Mouser; LCSC Part Number: C522648; Manufacturer Part Number: 471KD10J; RoHS: Yes; Item Type: Varistors; Stock: 1519; Pricing: 1=0.43, 10=0.27, 50=0.27, 100=0.187, 1000=0.145, 10000=0.096 (USD)
U15 = AFE3010AIRGTR: IC GRND FAULT CIRC INTER 16-VQFN; Manufacturer: Texas Instruments; Supplier: Mouser; LCSC Part Number: C17533396; Manufacturer Part Number: AFE3010AIRGTR; RoHS: Yes; Item Type: IC; Stock: 1960; Pricing: 1=1.66, 10=1.61, 50=1.61, 100=1.61, 1000=1.23, 10000=0.749 (USD)